# Altium schematic sheet STM32_Sheet.SchDoc (part 1 of 3)
size 420 x 297 mm; SheetNumber: 4; SheetTotal: 9
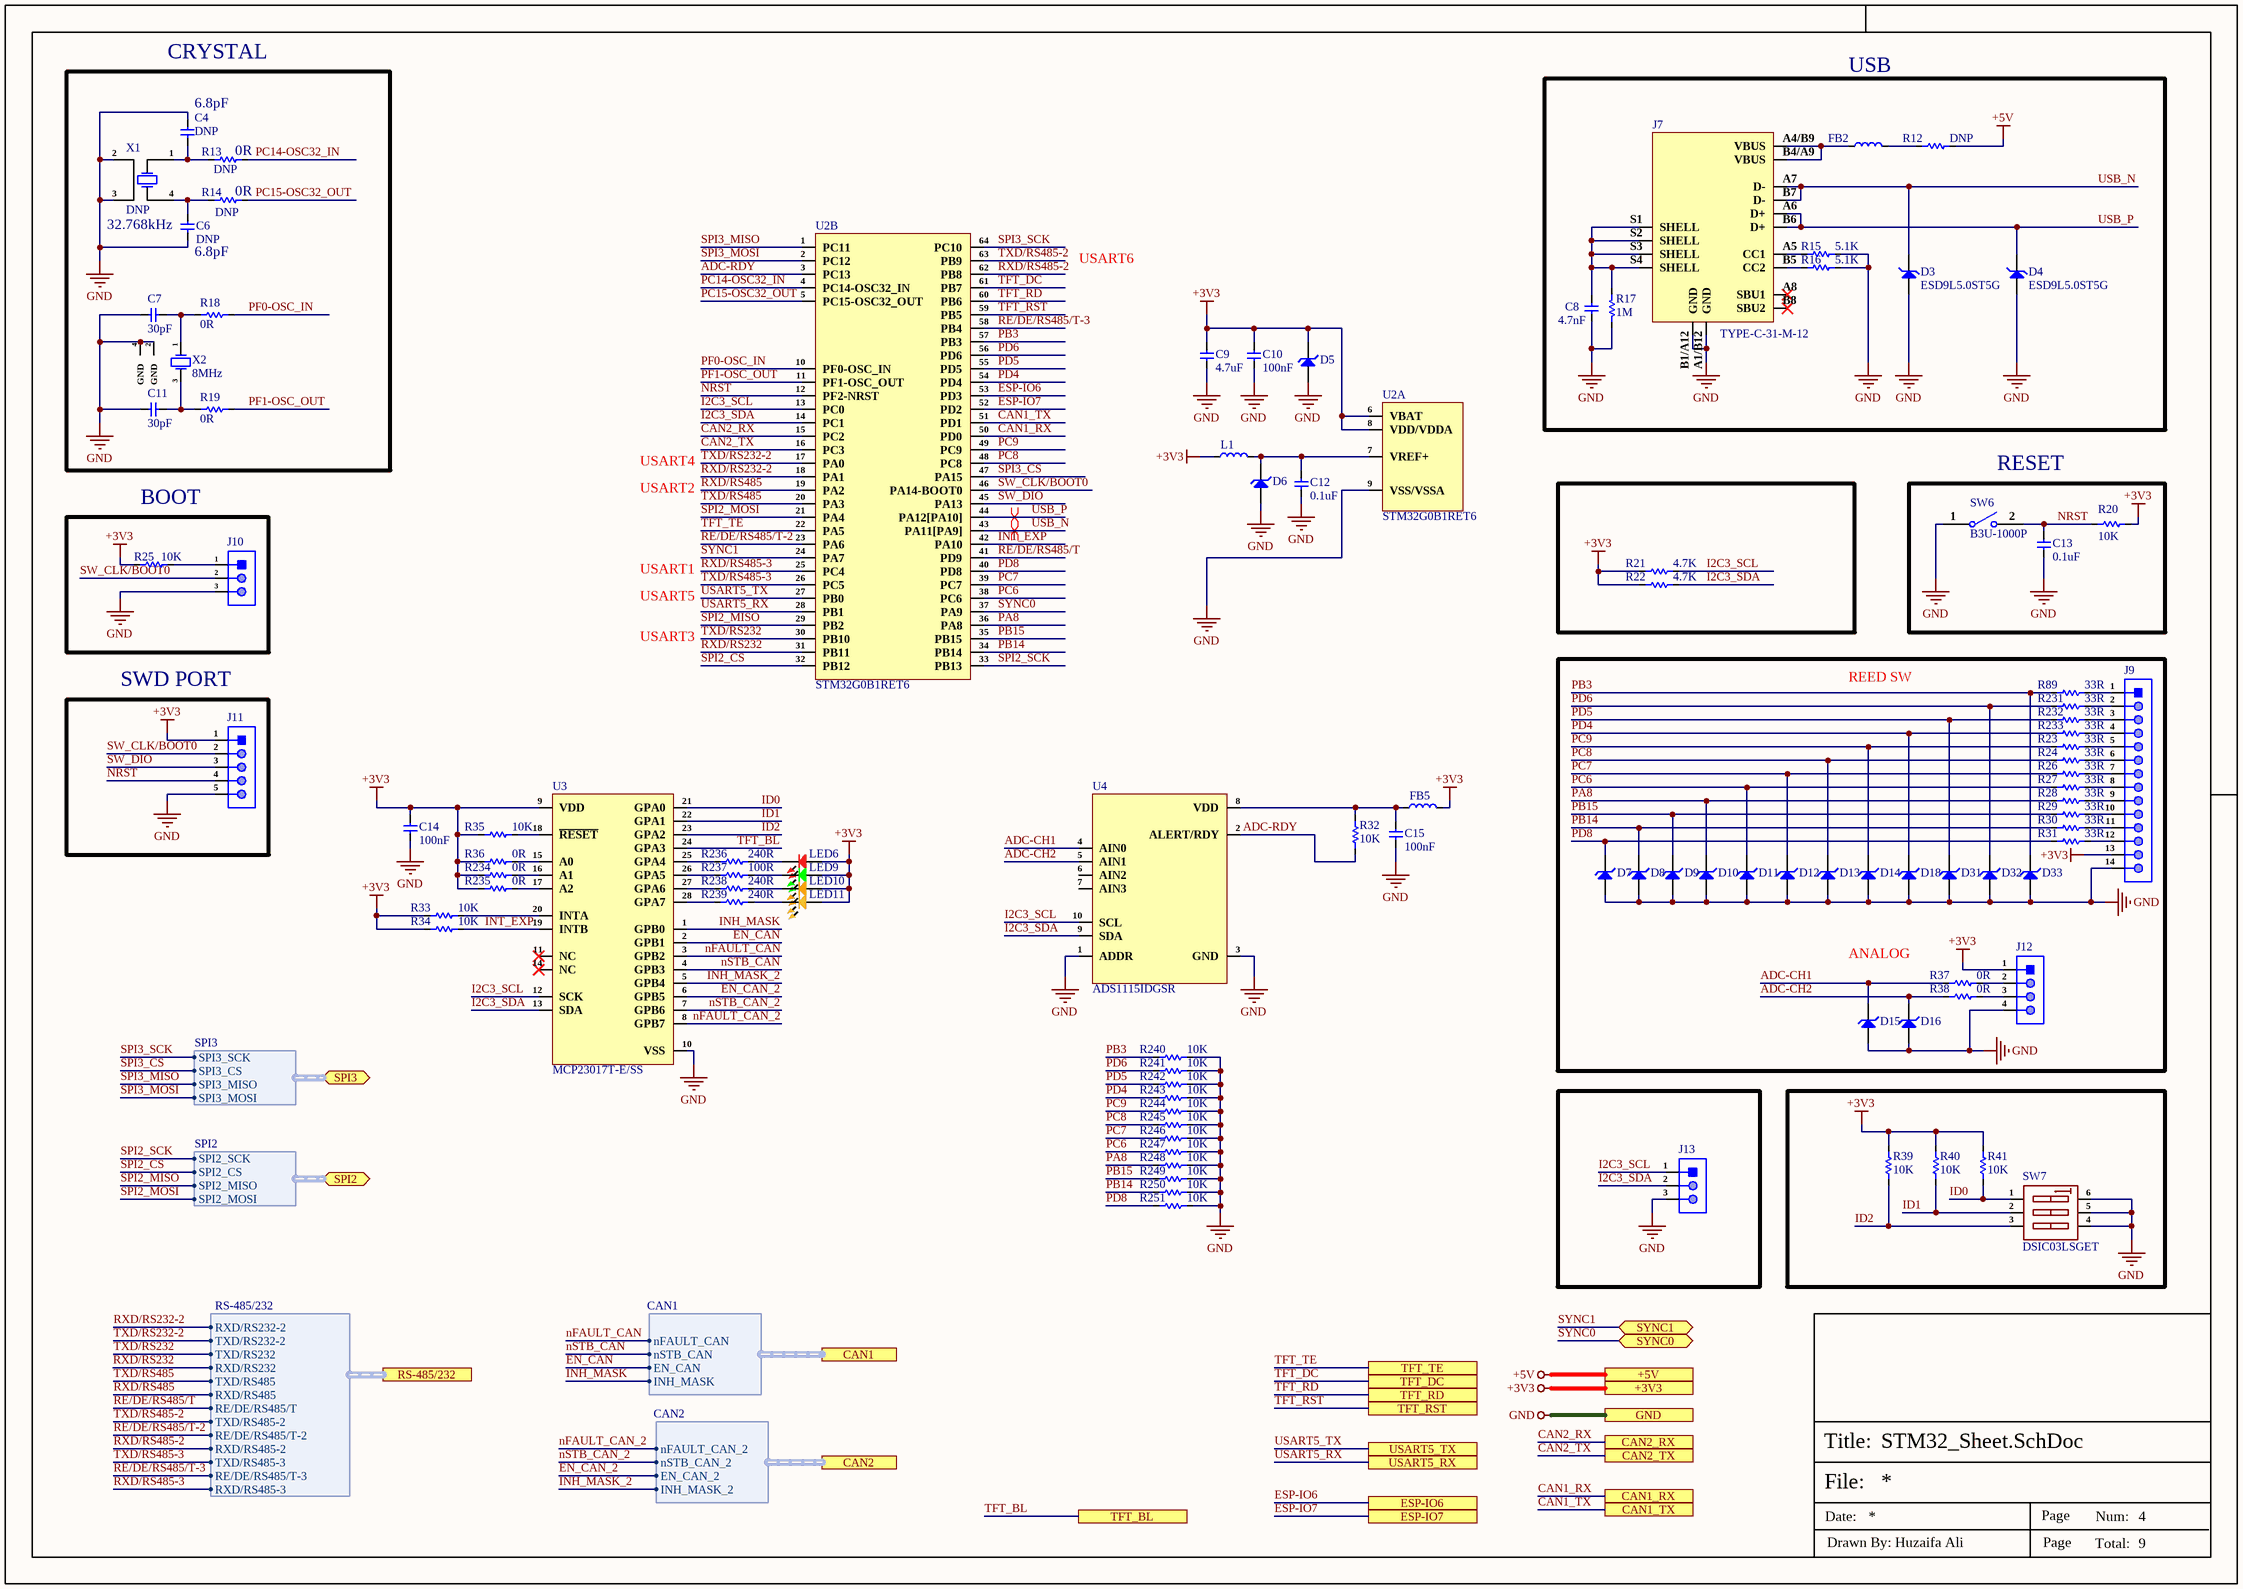
[diagram p0: STM32_Sheet.SchDoc]

## Parts
C4  DNP  [Cap-0402]
C6  DNP  [Cap-0402]
C7  30pF  [Cap-0402]
C8  4.7nF  [Cap-0603]
C9  4.7uF  [Cap-0402]
C10  100nF  [cap-0402]
C11  30pF  [Cap-0402]
C12  0.1uF  [Cap-0402]
C13  0.1uF  [Cap-0402]
C14  100nF  [cap-0402]
C15  100nF  [cap-0402]
D3  ESD9L5.0ST5G  [SOD-923.]
D4  ESD9L5.0ST5G  [SOD-923.]
D5  SD03  [SOD-323]  (value not drawn)
D6  SD03  [SOD-323]  (value not drawn)
D7  MM3Z3V3  [SOD-323]  (value not drawn)
D8  MM3Z3V3  [SOD-323]  (value not drawn)
D9  MM3Z3V3  [SOD-323]  (value not drawn)
D10  MM3Z3V3  [SOD-323]  (value not drawn)
D11  MM3Z3V3  [SOD-323]  (value not drawn)
D12  MM3Z3V3  [SOD-323]  (value not drawn)
D13  MM3Z3V3  [SOD-323]  (value not drawn)
D14  MM3Z3V3  [SOD-323]  (value not drawn)
D15  MM3Z3V3  [SOD-323]  (value not drawn)
D16  MM3Z3V3  [SOD-323]  (value not drawn)
D18  MM3Z3V3  [SOD-323]  (value not drawn)
D31  MM3Z3V3  [SOD-323]  (value not drawn)
D32  MM3Z3V3  [SOD-323]  (value not drawn)
D33  MM3Z3V3  [SOD-323]  (value not drawn)
FB2  BLM18PG221SN1D  [IND-0603 (1608 Metric)]  (value not drawn)
FB5  BLM18PG221SN1D  [IND-0603 (1608 Metric)]  (value not drawn)
J7  TYPE-C-31-M-12  [TYPE-C-31-M-12_]
J9  X6511WV-14H-C60D30  [HDR 1x14 TH Male]  (value not drawn)
J10  68000-103HLF  [HDR1X3_]  (value not drawn)
J11  X6511WV-05H-C60D30  [HDR1X5_]  (value not drawn)
J12  X6511WV-04H-C60D30  [HDR1X4_]  (value not drawn)
J13  B3B-XH-A(LF)(SN)  [B3B-XH-A(LF)(SN)_]  (value not drawn)
L1  BLM15AG601SN1D  [IND-0402]  (value not drawn)
LED6  RED  [LED-0603]  (value not drawn)
LED9  Emerald  [LED-0603]  (value not drawn)
LED10  NCD0603O2  [LED-0603]  (value not drawn)
LED11  Yellow  [LED-0603]  (value not drawn)
R12  DNP  [Res-0402]
R13  DNP  [Res-0603]
R14  DNP  [Res-0603]
R15  5.1K  [Res-0402]
R16  5.1K  [Res-0402]
R17  1M  [Res-0402]
R18  0R  [Res-0603]
R19  0R  [Res-0603]
R20  10K  [Res-0402]
R21  4.7K  [Res-0402]
R22  4.7K  [Res-0402]
R23  33R  [Res-0402]
R24  33R  [Res-0402]
R25  10K  [Res-0402]
R26  33R  [Res-0402]
R27  33R  [Res-0402]
R28  33R  [Res-0402]
R29  33R  [Res-0402]
R30  33R  [Res-0402]
R31  33R  [Res-0402]
R32  10K  [Res-0402]
R33  10K  [Res-0402]
R34  10K  [Res-0402]
R35  10K  [Res-0402]
R36  0R  [Res-0402]
R37  0R  [Res-0402]
R38  0R  [Res-0402]
R39  10K  [Res-0402]
R40  10K  [Res-0402]
R41  10K  [Res-0402]
R89  33R  [Res-0402]
R231  33R  [Res-0402]
R232  33R  [Res-0402]
R233  33R  [Res-0402]
R234  0R  [Res-0402]
R235  0R  [Res-0402]
R236  240R  [Res-0402]
R237  100R  [Res-0402]
R238  240R  [Res-0402]
R239  240R  [Res-0402]
R240  10K  [Res-0402]
R241  10K  [Res-0402]
R242  10K  [Res-0402]
R243  10K  [Res-0402]
R244  10K  [Res-0402]
R245  10K  [Res-0402]
R246  10K  [Res-0402]
R247  10K  [Res-0402]
R248  10K  [Res-0402]
R249  10K  [Res-0402]
R250  10K  [Res-0402]
R251  10K  [Res-0402]
SW6  B3U-1000P  [B3U-1000P]
SW7  DSIC03LSGET  [DSIC03LSGET]
U2  STM32G0B1RET6  [LQFP-64(10x10)]  (parts A,B of 2)
U3  MCP23017T-E/SS  [SSOP-28-208mil]
U4  ADS1115IDGSR  [VSSOP-10]
X1  DNP  [MC-306]
X2  8MHz  [5TJ480000XYLBC_]

## Blocks framed on the sheet
CRYSTAL: C4 C6 C7 C11 R13 R14 R18 R19 X1 X2
USB: C8 D3 D4 FB2 J7 R12 R15-R17
BOOT: J10 R25
RESET: C13 R20 SW6
SWD PORT: J11

## Ports
+3V3 (see Top-Sheet[4A], CAN_Sheet[5D], ESP32_Sheet[5D], EtherCAT_Sheet[5D], Ethernet_Sheet[5D], Power_Sheet[5D], RS485_RS232_Sheet[5D], TFT_Display_Sheet[5D]), +5V (see Top-Sheet[4A], CAN_Sheet[5D], Power_Sheet[5D], TFT_Display_Sheet[5D]), CAN1 (harness CAN1, see Top-Sheet[4B], CAN_Sheet[3D]), CAN1_RX (see Top-Sheet[4B], CAN_Sheet[2D]), CAN1_TX (see Top-Sheet[4B], CAN_Sheet[2D]), CAN2 (harness CAN2, see Top-Sheet[4B], CAN_Sheet[3D]), CAN2_RX (see Top-Sheet[4B], CAN_Sheet[2D]), CAN2_TX (see Top-Sheet[4B], CAN_Sheet[2D]), ESP-IO6 (see Top-Sheet[4B], ESP32_Sheet[3D]), ESP-IO7 (see Top-Sheet[4B], ESP32_Sheet[3D]), GND (see Top-Sheet[4B], CAN_Sheet[5D], ESP32_Sheet[5D], EtherCAT_Sheet[5D], Ethernet_Sheet[5D], Power_Sheet[5D], RS485_RS232_Sheet[5D], TFT_Display_Sheet[5D]), RS-485/232 (harness RS-485/232, see Top-Sheet[4B], RS485_RS232_Sheet[2D]), SPI2 (bidir, harness SPI2, see Top-Sheet[4B], TFT_Display_Sheet[3D]), SPI3 (bidir, harness SPI3, see Top-Sheet[4C], EtherCAT_Sheet[1D]), SYNC0 (bidir, see Top-Sheet[4C], EtherCAT_Sheet[5D]), SYNC1 (bidir, see Top-Sheet[4C], EtherCAT_Sheet[5D]), TFT_BL (see Top-Sheet[4C], TFT_Display_Sheet[5D]), TFT_DC (see Top-Sheet[4C], TFT_Display_Sheet[5D]), TFT_RD (see Top-Sheet[4C], TFT_Display_Sheet[5D]), TFT_RST (see Top-Sheet[4C], TFT_Display_Sheet[5D]), TFT_TE (see Top-Sheet[4B], TFT_Display_Sheet[5D]), USART5_RX (see Top-Sheet[4B], ESP32_Sheet[3D]), USART5_TX (see Top-Sheet[4B], ESP32_Sheet[3D])

## Harnesses
CAN1: nFAULT_CAN, nSTB_CAN, EN_CAN, INH_MASK
CAN2: nFAULT_CAN_2, nSTB_CAN_2, EN_CAN_2, INH_MASK_2
SPI3: SPI3_SCK, SPI3_CS, SPI3_MISO, SPI3_MOSI
SPI2: SPI2_SCK, SPI2_CS, SPI2_MISO, SPI2_MOSI
RS-485/232: TXD/RS232, RXD/RS232, TXD/RS485, RXD/RS485, RE/DE/RS485/T, TXD/RS485-2, RE/DE/RS485/T-2, RXD/RS485-2, TXD/RS232-2, RXD/RS232-2, TXD/RS485-3, RE/DE/RS485/T-3, RXD/RS485-3

## Nets
+3V3: C9.2 C10.2 C14.2 D5.1(K) FB5.2 J9.13 J11.1 J12.1 L1.1 LED6.1 LED9.1 LED10.1 LED11.1 R20.2 R21.2 R22.2 R25.2 R33.2 R34.2 R35.2 R36.1 R39.2 R40.2 R41.2 R234.1 R235.1 U2.6(VBAT) U2.8(VDD/VDDA) U3.9(VDD) ; port +3V3
+5V: R12.2 ; port +5V
GND: C4.1 C6.2 C7.1 C8.1 C9.1 C10.1 C11.1 C12.1 C13.1 C14.1 C15.2 D3.2(A) D4.2(A) D5.2(A) D6.2(A) D7.2(A) D8.2(A) D9.2(A) D10.2(A) D11.2(A) D12.2(A) D13.2(A) D14.2(A) D15.2(A) D16.2(A) D18.2(A) D31.2(A) D32.2(A) D33.2(A) J7.A1/B12(GND) J7.B1/A12(GND) J9.14 J10.3 J11.5 J12.4 J13.3 R15.2 R16.2 R17.2 R240.1 R241.1 R242.1 R243.1 R244.1 R245.1 R246.1 R247.1 R248.1 R249.1 R250.1 R251.1 SW6.1 SW7.4(B3) SW7.5(B2) SW7.6(B1) U2.9(VSS/VSSA) U3.10(VSS) U4.1(ADDR) U4.3(GND) X1.2 X1.3 X2.2(GND) X2.4(GND) ; port GND
ADC-CH1: D15.1(K) R37.1 U4.4(AIN0)
ADC-CH2: D16.1(K) R38.1 U4.5(AIN1)
ADC-RDY: R32.2 U2.3(PC13) U4.2(ALERT/RDY)
CAN1_RX: U2.50(PD0) ; port CAN1_RX
CAN1_TX: U2.51(PD1) ; port CAN1_TX
CAN2_RX: U2.15(PC2) ; port CAN2_RX
CAN2_TX: U2.16(PC3) ; port CAN2_TX
EN_CAN: U3.2(GPB1) ; port CAN1.EN_CAN
EN_CAN_2: U3.6(GPB5) ; port CAN2.EN_CAN_2
ESP-IO6: U2.53(PD3) ; port ESP-IO6
ESP-IO7: U2.52(PD2) ; port ESP-IO7
I2C3_SCL: J13.1 R21.1 U2.13(PC0) U3.12(SCK) U4.10(SCL)
I2C3_SDA: J13.2 R22.1 U2.14(PC1) U3.13(SDA) U4.9(SDA)
ID0: R41.1 SW7.1(A1) U3.21(GPA0)
ID1: R40.1 SW7.2(A2) U3.22(GPA1)
ID2: R39.1 SW7.3(A3) U3.23(GPA2)
INH_MASK: U3.1(GPB0) ; port CAN1.INH_MASK
INH_MASK_2: U3.5(GPB4) ; port CAN2.INH_MASK_2
INT_EXP: R34.1 U2.42(PA10) U3.19(INTB)
nFAULT_CAN: U3.3(GPB2) ; port CAN1.nFAULT_CAN
nFAULT_CAN_2: U3.8(GPB7) ; port CAN2.nFAULT_CAN_2
NRST: C13.2 J11.4 R20.1 SW6.2 U2.12(PF2-NRST)
nSTB_CAN: U3.4(GPB3) ; port CAN1.nSTB_CAN
nSTB_CAN_2: U3.7(GPB6) ; port CAN2.nSTB_CAN_2
PA8: D10.1(K) R28.1 R248.2 U2.36(PA8)
PB3: D33.1(K) R89.1 R240.2 U2.57(PB3)
PB14: D8.1(K) R30.1 R250.2 U2.34(PB14)
PB15: D9.1(K) R29.1 R249.2 U2.35(PB15)
PC6: D11.1(K) R27.1 R247.2 U2.38(PC6)
PC7: D12.1(K) R26.1 R246.2 U2.39(PC7)
PC8: D13.1(K) R24.1 R245.2 U2.48(PC8)
PC9: D14.1(K) R23.1 R244.2 U2.49(PC9)
PC14-OSC32_IN: R13.2 U2.4(PC14-OSC32_IN)
PC15-OSC32_OUT: R14.2 U2.5(PC15-OSC32_OUT)
PD4: D18.1(K) R233.1 R243.2 U2.54(PD4)
PD5: D31.1(K) R232.1 R242.2 U2.55(PD5)
PD6: D32.1(K) R231.1 R241.2 U2.56(PD6)
PD8: D7.1(K) R31.1 R251.2 U2.40(PD8)
PF0-OSC_IN: R18.2 U2.10(PF0-OSC_IN)
PF1-OSC_OUT: R19.2 U2.11(PF1-OSC_OUT)
RE/DE/RS485/T: U2.41(PD9) ; port RS-485/232.RE/DE/RS485/T
RE/DE/RS485/T-2: U2.23(PA6) ; port RS-485/232.RE/DE/RS485/T-2
RE/DE/RS485/T-3: U2.58(PB4) ; port RS-485/232.RE/DE/RS485/T-3
RXD/RS232: U2.31(PB11) ; port RS-485/232.RXD/RS232
RXD/RS232-2: U2.18(PA1) ; port RS-485/232.RXD/RS232-2
RXD/RS485: U2.19(PA2) ; port RS-485/232.RXD/RS485
RXD/RS485-2: U2.62(PB8) ; port RS-485/232.RXD/RS485-2
RXD/RS485-3: U2.25(PC4) ; port RS-485/232.RXD/RS485-3
SPI2_CS: U2.32(PB12) ; port SPI2.SPI2_CS
SPI2_MISO: U2.29(PB2) ; port SPI2.SPI2_MISO
SPI2_MOSI: U2.21(PA4) ; port SPI2.SPI2_MOSI
SPI2_SCK: U2.33(PB13) ; port SPI2.SPI2_SCK
SPI3_CS: U2.47(PA15) ; port SPI3.SPI3_CS
SPI3_MISO: U2.1(PC11) ; port SPI3.SPI3_MISO
SPI3_MOSI: U2.2(PC12) ; port SPI3.SPI3_MOSI
SPI3_SCK: U2.64(PC10) ; port SPI3.SPI3_SCK
SW_CLK/BOOT0: J10.2 J11.2 U2.46(PA14-BOOT0)
SW_DIO: J11.3 U2.45(PA13)
SYNC0: U2.37(PA9) ; port SYNC0
SYNC1: U2.24(PA7) ; port SYNC1
TFT_BL: U3.24(GPA3) ; port TFT_BL
TFT_DC: U2.61(PB7) ; port TFT_DC
TFT_RD: U2.60(PB6) ; port TFT_RD
TFT_RST: U2.59(PB5) ; port TFT_RST
TFT_TE: U2.22(PA5) ; port TFT_TE
TXD/RS232: U2.30(PB10) ; port RS-485/232.TXD/RS232
TXD/RS232-2: U2.17(PA0) ; port RS-485/232.TXD/RS232-2
TXD/RS485: U2.20(PA3) ; port RS-485/232.TXD/RS485
TXD/RS485-2: U2.63(PB9) ; port RS-485/232.TXD/RS485-2
TXD/RS485-3: U2.26(PC5) ; port RS-485/232.TXD/RS485-3
USART5_RX: U2.28(PB1) ; port USART5_RX
USART5_TX: U2.27(PB0) ; port USART5_TX
USB_N: D3.1(K) J7.A7(D-) J7.B7(D-) U2.43(PA11[PA9])
USB_P: D4.1(K) J7.A6(D+) J7.B6(D+) U2.44(PA12[PA10])
NetC4_2: C4.2 R13.1 X1.1(OSC1)
NetC6_1: C6.1 R14.1 X1.4(OSC2)
NetC7_2: C7.2 R18.1 X2.1(OSC1)
NetC8_2: C8.2 J7.S1(SHELL) J7.S2(SHELL) J7.S3(SHELL) J7.S4(SHELL) R17.1
NetC11_2: C11.2 R19.1 X2.3(OSC2)
NetC12_2: C12.2 D6.1(K) L1.2 U2.7(VREF+)
NetC15_1: C15.1 FB5.1 R32.1 U4.8(VDD)
NetFB2_1: FB2.1 J7.A4/B9(VBUS) J7.B4/A9(VBUS)
NetFB2_2: FB2.2 R12.1
NetJ7_A5: J7.A5(CC1) R15.1
NetJ7_B5: J7.B5(CC2) R16.1
NetJ9_1: J9.1 R89.2
NetJ9_2: J9.2 R231.2
NetJ9_3: J9.3 R232.2
NetJ9_4: J9.4 R233.2
NetJ9_5: J9.5 R23.2
NetJ9_6: J9.6 R24.2
NetJ9_7: J9.7 R26.2
NetJ9_8: J9.8 R27.2
NetJ9_9: J9.9 R28.2
NetJ9_10: J9.10 R29.2
NetJ9_11: J9.11 R30.2
NetJ9_12: J9.12 R31.2
NetJ10_1: J10.1 R25.1
NetJ12_2: J12.2 R37.2
NetJ12_3: J12.3 R38.2
NetLED6_2: LED6.2 R236.2
NetLED9_2: LED9.2 R237.2
NetLED10_2: LED10.2 R238.2
NetLED11_2: LED11.2 R239.2
NetR33_1: R33.1 U3.20(INTA)
NetR35_1: R35.1 U3.18(~{RESET})
NetR36_2: R36.2 U3.15(A0)
NetR234_2: R234.2 U3.16(A1)
NetR235_2: R235.2 U3.17(A2)
NetR236_1: R236.1 U3.25(GPA4)
NetR237_1: R237.1 U3.26(GPA5)
NetR238_1: R238.1 U3.27(GPA6)
NetR239_1: R239.1 U3.28(GPA7)

Not connected (* = marked no-connect by the designer): J7 A8(SBU1)* B8(SBU2)*; U3 11(NC)* 14(NC)*; U4 6(AIN2) 7(AIN3)

## Layout directives
differential pair; net class USB_PROGRAM; differential pair class USB_PROGRAM_LINES; rule Impedance Constraint [Min = 85.00    Max = 90.00    ]; rule Matched Net Lengths [Tolerance = 50mil]: USB_N, USB_P

## Notes on the sheet
- (near C4) 6.8pF
- (near R13) 0R
- 32.768kHz
- (near C6) 6.8pF
- (near R14) 0R
- USART6
- USART2
- USART4
- USART1
- USART3
- USART5
- REED SW
- ANALOG
- File:
- Title:
- Date:
- Page
- Num:
- Total:
- Drawn By: Huzaifa Ali